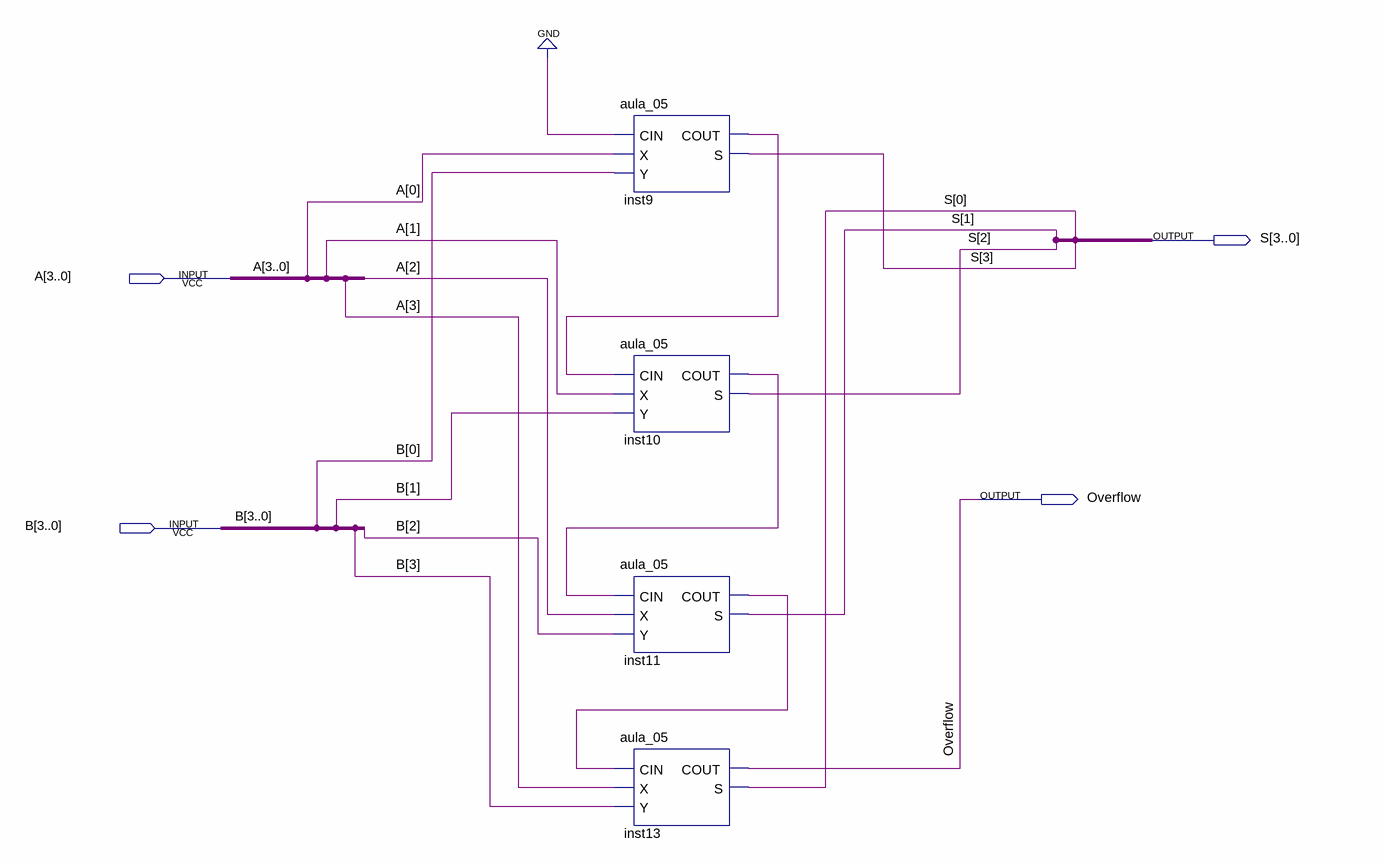
[diagram p0: schematic sheet]
// Quartus schematic aula_06.bdf as structural Verilog: 4 symbols, 4 pins
module aula_06 (
  input  [3:0] A,
  input  [3:0] B,
  output [3:0] S,
  output Overflow
);

  wire inst9_cout, inst10_cout, inst11_cout;

  aula_05 inst9 (.CIN(1'b0), .X(A[0]), .Y(B[0]), .COUT(inst9_cout), .S(S[3]));
  aula_05 inst10 (.CIN(inst9_cout), .X(A[1]), .Y(B[1]), .COUT(inst10_cout), .S(S[2]));
  aula_05 inst11 (.CIN(inst10_cout), .X(A[2]), .Y(B[2]), .COUT(inst11_cout), .S(S[1]));
  aula_05 inst13 (.CIN(inst11_cout), .X(A[3]), .Y(B[3]), .COUT(Overflow), .S(S[0]));
endmodule
